# Altium project PCB_Project.PrjPcb
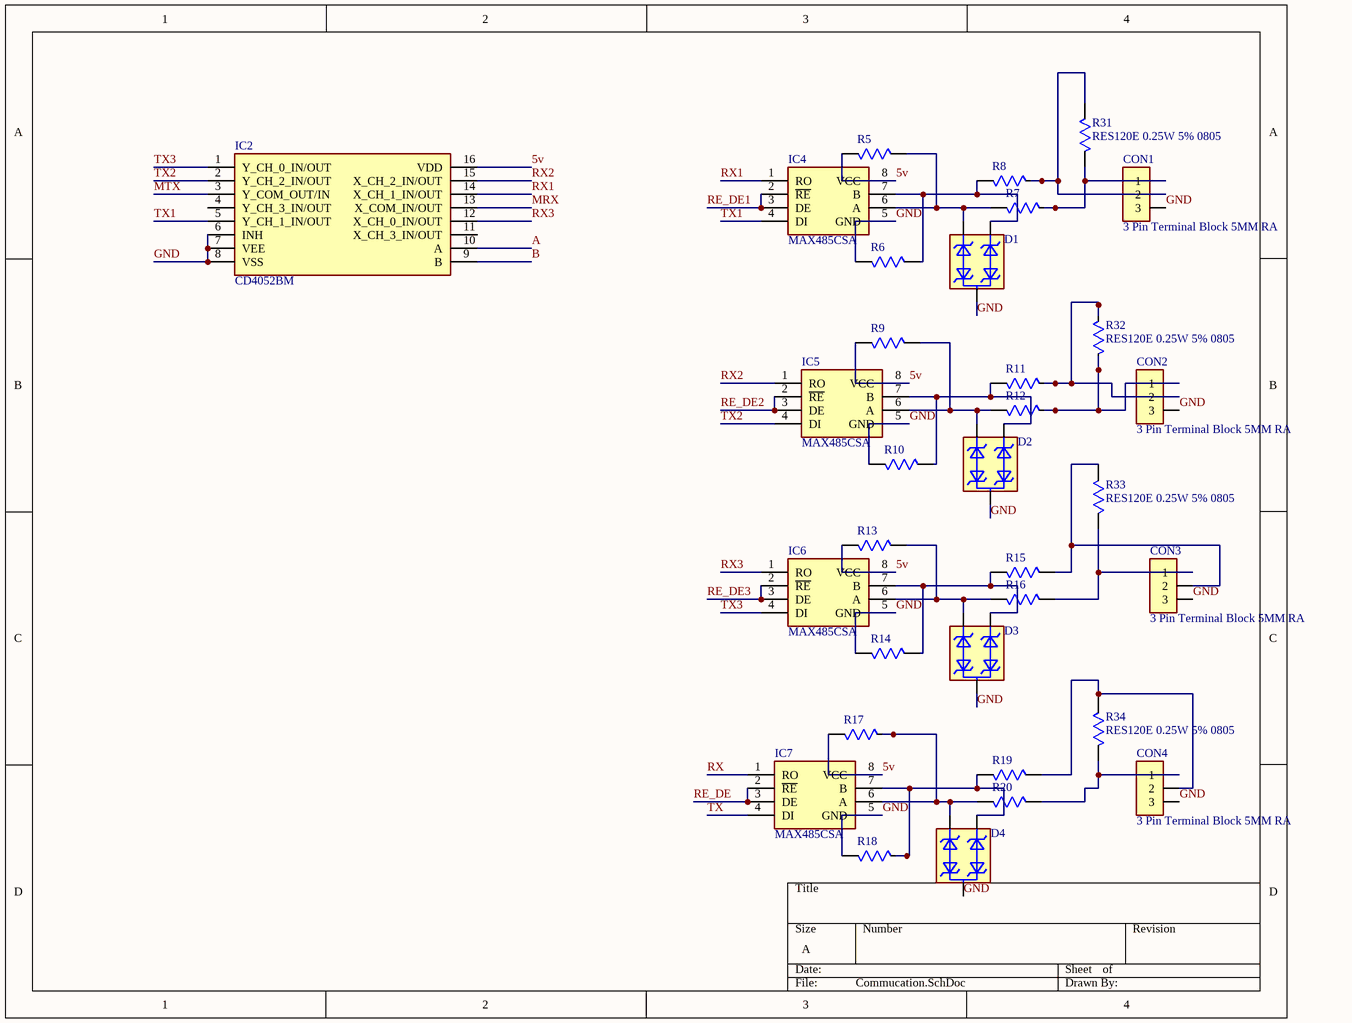
[diagram p0: Commucation.SchDoc]
2 sheets, 57 parts. Net scope: global (net labels, ports and power ports of the same name join across sheets).
Board file: PCB1.PcbDoc
Sheets:
  Commucation.SchDoc
  Power.SchDoc

## Sheet Commucation.SchDoc
size A; SheetNumber: 2; SheetTotal: 3

### Parts
CON1  3 Pin Terminal Block 5MM RA  [3 Pin Terminal Block 5MM RA]
CON2  3 Pin Terminal Block 5MM RA  [3 Pin Terminal Block 5MM RA]
CON3  3 Pin Terminal Block 5MM RA  [3 Pin Terminal Block 5MM RA]
CON4  3 Pin Terminal Block 5MM RA  [3 Pin Terminal Block 5MM RA]
D1  SM712-02HTG  [SOT23]  (value not drawn)
D2  SM712-02HTG  [SOT23]  (value not drawn)
D3  SM712-02HTG  [SOT23]  (value not drawn)
D4  SM712-02HTG  [SOT23]  (value not drawn)
IC2  CD4052BM  [SOIC127P600X175-16N]
IC4  MAX485CSA  [SOIC127P600X175-8N]
IC5  MAX485CSA  [SOIC127P600X175-8N]
IC6  MAX485CSA  [SOIC127P600X175-8N]
IC7  MAX485CSA  [SOIC127P600X175-8N]
R5  RES4.7K 0.25W 5% 0805  [RES 0805 10K/0.25W 5%]  (value not drawn)
R6  RES4.7K 0.25W 5% 0805  [RES 0805 10K/0.25W 5%]  (value not drawn)
R7  RES100E 0.25W 5% 0805  [RES 0805 10K/0.25W 5%]  (value not drawn)
R8  RES100E 0.25W 5% 0805  [RES 0805 10K/0.25W 5%]  (value not drawn)
R9  RES4.7K 0.25W 5% 0805  [RES 0805 10K/0.25W 5%]  (value not drawn)
R10  RES4.7K 0.25W 5% 0805  [RES 0805 10K/0.25W 5%]  (value not drawn)
R11  RES100E 0.25W 5% 0805  [RES 0805 10K/0.25W 5%]  (value not drawn)
R12  RES100E 0.25W 5% 0805  [RES 0805 10K/0.25W 5%]  (value not drawn)
R13  RES4.7K 0.25W 5% 0805  [RES 0805 10K/0.25W 5%]  (value not drawn)
R14  RES4.7K 0.25W 5% 0805  [RES 0805 10K/0.25W 5%]  (value not drawn)
R15  RES100E 0.25W 5% 0805  [RES 0805 10K/0.25W 5%]  (value not drawn)
R16  RES100E 0.25W 5% 0805  [RES 0805 10K/0.25W 5%]  (value not drawn)
R17  RES4.7K 0.25W 5% 0805  [RES 0805 10K/0.25W 5%]  (value not drawn)
R18  RES4.7K 0.25W 5% 0805  [RES 0805 10K/0.25W 5%]  (value not drawn)
R19  RES100E 0.25W 5% 0805  [RES 0805 10K/0.25W 5%]  (value not drawn)
R20  RES100E 0.25W 5% 0805  [RES 0805 10K/0.25W 5%]  (value not drawn)
R31  RES120E 0.25W 5% 0805  [RES 0805 10K/0.25W 5%]
R32  RES120E 0.25W 5% 0805  [RES 0805 10K/0.25W 5%]
R33  RES120E 0.25W 5% 0805  [RES 0805 10K/0.25W 5%]
R34  RES120E 0.25W 5% 0805  [RES 0805 10K/0.25W 5%]

### Nets
5v: IC2.16(VDD) IC4.8(VCC) IC5.8(VCC) IC6.8(VCC) IC7.8(VCC) R5.1 R9.1 R13.1 R17.1
A: IC2.10(A)
B: IC2.9(B)
GND: CON1.3 CON2.3 CON3.3 CON4.3 D1.3 D2.3 D3.3 D4.3 IC2.6(INH) IC2.7(VEE) IC2.8(VSS) IC4.5(GND) IC5.5(GND) IC6.5(GND) IC7.5(GND) R6.1 R10.1 R14.1 R18.1
MRX: IC2.13(X_COM_IN/OUT)
MTX: IC2.3(Y_COM_OUT/IN)
RE_DE: IC7.2(~{RE}) IC7.3(DE)
RE_DE1: IC4.2(~{RE}) IC4.3(DE)
RE_DE2: IC5.2(~{RE}) IC5.3(DE)
RE_DE3: IC6.2(~{RE}) IC6.3(DE)
RX: IC7.1(RO)
RX1: IC2.14(X_CH_1_IN/OUT) IC4.1(RO)
RX2: IC2.15(X_CH_2_IN/OUT) IC5.1(RO)
RX3: IC2.12(X_CH_0_IN/OUT) IC6.1(RO)
TX: IC7.4(DI)
TX1: IC2.5(Y_CH_1_IN/OUT) IC4.4(DI)
TX2: IC2.2(Y_CH_2_IN/OUT) IC5.4(DI)
TX3: IC2.1(Y_CH_0_IN/OUT) IC6.4(DI)
NetCON1_1: CON1.1 R7.2 R31.1
NetCON1_2: CON1.2 R8.2 R31.2
NetCON2_1: CON2.1 R12.2 R32.1
NetCON2_2: CON2.2 R11.2 R32.2
NetCON3_1: CON3.1 R16.2 R33.1
NetCON3_2: CON3.2 R15.2 R33.2
NetCON4_1: CON4.1 R20.2 R34.1
NetCON4_2: CON4.2 R19.2 R34.2
NetD1_1: D1.1 IC4.7(B) R6.2 R8.1
NetD1_2: D1.2 IC4.6(A) R5.2 R7.1
NetD2_1: D2.1 IC5.7(B) R10.2 R11.1
NetD2_2: D2.2 IC5.6(A) R9.2 R12.1
NetD3_1: D3.1 IC6.7(B) R14.2 R15.1
NetD3_2: D3.2 IC6.6(A) R13.2 R16.1
NetD4_1: D4.1 IC7.7(B) R18.2 R19.1
NetD4_2: D4.2 IC7.6(A) R17.2 R20.1

Not connected (* = marked no-connect by the designer): IC2 4(Y_CH_3_IN/OUT) 11(X_CH_3_IN/OUT)

### Library data of the parts
CON1-CON4 = 3 Pin Terminal Block 5MM RA: 3 Pin Terminal Block HDR 5MM THT RA 231-433_001-000; MP: 231-433/001-000; MF: WAGO; SnapEDA_Link: https://www.snapeda.com/parts/231-433/001-000/WAGO/view-part/482062/?ref=snap; Package: None; Availability: Unavailable; Price: None; Value: *
D1-D4 = SM712-02HTG: TVS Diode, SM712 Series, 31V Clamp, 600W Peak Pulse, Surface Mount, SOT23-3 | Littelfuse SM712-02HTG; MF: Littelfuse Inc.; SnapEDA_Link: https://www.snapeda.com/parts/SM712-02HTG/Littelfuse/view-part/?ref=snap; Package: SOT-23 Littelfuse Inc.; Value: *; MP: SM712-02HTG; Check_prices: https://www.snapeda.com/parts/SM712-02HTG/Littelfuse/view-part/?ref=eda
IC2 = CD4052BM: CMOS Differential 4-Channel Analog Multiplexer/Demultiplexer with Logic-Level Conversion; Manufacturer_Name: Texas Instruments; Geometry.Height: 1.75mm; Manufacturer_Part_Number: CD4052BM; Mouser Part Number: 595-CD4052BM; Mouser Price/Stock: https://www.mouser.co.uk/ProductDetail/Texas-Instruments/CD4052BM?qs=LSR%252BNeaw%2FwAMfT6cddU6yA%3D%3D; Arrow Part Number: CD4052BM; Arrow Price/Stock: https://www.arrow.com/en/products/cd4052bm/texas-instruments?region=nac; Datasheet Link: http://www.ti.com/lit/ds/symlink/cd4052b.pdf
IC4-IC7 = MAX485CSA: Maxim MAX485CSA, Line Transceiver, RS-422, RS-485, 4.75  5.25 V, 8-Pin SOIC; Manufacturer_Name: Analog Devices; Geometry.Height: 1.75mm; Manufacturer_Part_Number: MAX485CSA; Mouser Part Number: N/A; Mouser Price/Stock: https://www.mouser.co.uk/ProductDetail/Maxim-Integrated/MAX485CSA?qs=LHmEVA8xxfbb%2FSUlm%252BHF3Q%3D%3D; Arrow Part Number: *; Arrow Price/Stock: *; Datasheet Link: https://datasheets.maximintegrated.com/en/ds/MAX1487-MAX491.pdf
R5 = RES 10K 0.25W 5% 0805: RESISTOR, THICK FILM, 4.7K, 5%, 0805 0.25W SMT; MP: ERJ-6GEYJ103V; MF: Panasonic Electronic; Price: None; Check_prices: https://www.snapeda.com/parts/ERJ-6GEYJ103V/Panasonic+Electronic+Components/view-part/?ref=eda; Package: 805-2 Panasonic; Purchase-URL: https://pricing.snapeda.com/search/part/ERJ-6GEYJ103V/?ref=eda; Availability: In Stock; SnapEDA_Link: https://www.snapeda.com/parts/ERJ-6GEYJ103V/Panasonic+Electronic+Components/view-part/?ref=snap; Value: *
R6-R20 = RES 10K 0.25W 5% 0805: RESISTOR, THICK FILM, 10K, 5%, 0805 0.25W SMT; MP: ERJ-6GEYJ103V; MF: Panasonic Electronic; Price: None; Check_prices: https://www.snapeda.com/parts/ERJ-6GEYJ103V/Panasonic+Electronic+Components/view-part/?ref=eda; Package: 805-2 Panasonic; Purchase-URL: https://pricing.snapeda.com/search/part/ERJ-6GEYJ103V/?ref=eda; Availability: In Stock; SnapEDA_Link: https://www.snapeda.com/parts/ERJ-6GEYJ103V/Panasonic+Electronic+Components/view-part/?ref=snap; Value: *
R31-R34 = RES 10K 0.25W 5% 0805_1: RESISTOR, THICK FILM, 10K, 5%, 0805 0.25W SMT; MP: ERJ-6GEYJ103V; MF: Panasonic Electronic; Price: None; Check_prices: https://www.snapeda.com/parts/ERJ-6GEYJ103V/Panasonic+Electronic+Components/view-part/?ref=eda; Package: 805-2 Panasonic; Purchase-URL: https://pricing.snapeda.com/search/part/ERJ-6GEYJ103V/?ref=eda; Availability: In Stock; SnapEDA_Link: https://www.snapeda.com/parts/ERJ-6GEYJ103V/Panasonic+Electronic+Components/view-part/?ref=snap; Value: *

## Sheet Power.SchDoc
size A; SheetNumber: 3; SheetTotal: 3
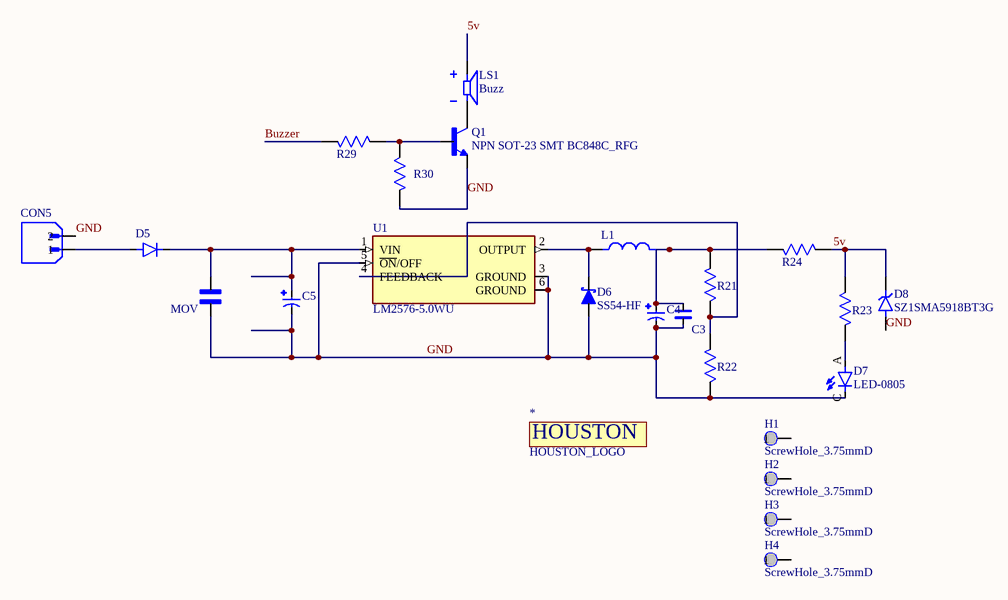
[diagram p1: Power.SchDoc]

### Parts
*  HOUSTON_LOGO  [HOUSTON_LOGO]
C3  CAP 0.1uF 50V 0805  [CAP CER 0.1uF/50V 5%]  (value not drawn)
C4  CAP ELE 10µF 25V TH  [CAP ELE 10µF 25V TH]  (value not drawn)
C5  CAP ELE 10µF 25V TH  [CAP ELE 10µF 25V TH]  (value not drawn)
CON5  2 Pin Terminal Block 5MM RA  [2 Pin Terminal Block 5MM RA]  (value not drawn)
D5  DIODE M7 DO-214AC  [DIODE M7 DO-214AC]  (value not drawn)
D6  SS54-HF  [DIOM5025X220N]
D7  LED-0805  [LED-0805]
D8  SZ1SMA5918BT3G  [DIOM5226X220N]
H1  ScrewHole_3.75mmD  [ScrewHole_3.75mmD - duplicate]
H2  ScrewHole_3.75mmD  [ScrewHole_3.75mmD - duplicate]
H3  ScrewHole_3.75mmD  [ScrewHole_3.75mmD - duplicate]
H4  ScrewHole_3.75mmD  [ScrewHole_3.75mmD - duplicate]
L1  INDUCTOR 8040S SWPA8040S120MT  [INDUCTOR 8040S SWPA8040S120MT]  (value not drawn)
LS1  Buzz  [CUI_CMI-1614-1285T]
MOV  Ceramic capacitor 3300pF4KV  [Ceramic capacitor 3300pF4KV]  (value not drawn)
Q1  NPN SOT-23 SMT BC848C_RFG  [NPN SOT-23 SMT BC848C_RFG]
R21  RES 3K 0.25W 5% 0805  [RES 0805 10K/0.25W 5%]  (value not drawn)
R22  RES 1K 0.25W 5% 0805  [RES 0805 10K/0.25W 5%]  (value not drawn)
R23  RES 330 E 0.25W 5% 0805  [RES 0805 10K/0.25W 5%]  (value not drawn)
R24  RES 3K 0.25W 5% 0805  [RES 0805 10K/0.25W 5%]  (value not drawn)
R29  RES 1K 0.25W 5% 0805  [RES 0805 10K/0.25W 5%]  (value not drawn)
R30  RES 10K 0.25W 5% 0805  [RES 0805 10K/0.25W 5%]  (value not drawn)
U1  LM2576-5.0WU  [DPAK6P170_1524X459L254X81N]

### Nets
5v: D8.C LS1.P R23.1 R24.1
Buzzer: R29.2
GND: C3.1 C4.N C5.N CON5.2 D6.2(A) D7.C D8.A MOV.1 Q1.2(E) R22.1 R30.2 U1.3(GROUND) U1.5(~{ON}/OFF) U1.6(GROUND)
NetC3_2: C3.2 C4.P L1.2 R21.2 R24.2
NetC5_P: C5.P D5.C(K) MOV.2 U1.1(VIN)
NetCON5_1: CON5.1 D5.A
NetD6_1: D6.1(K) L1.1 U1.2(OUTPUT)
NetD7_A: D7.A R23.2
NetLS1_N: LS1.N Q1.3(C)
NetQ1_1: Q1.1(B) R29.1 R30.1
NetR21_1: R21.1 R22.2 U1.4(FEEDBACK)

Not connected (* = marked no-connect by the designer): H1 1; H2 1; H3 1; H4 1

### Notes on the sheet
- (in symbol TANT CAP 10uF/16V 5% 3528(B)) +

### Library data of the parts
C3 = CAP CER 0.1uF/50V 5%: CAP CER 0.1uF/50V  Ceramic Capacitor X7R 0805 (2012 Metric) SMT; MF: Samsung; MP: CL21B104KCFNNNE; Purchase-URL: https://pricing.snapeda.com/search?q=CL21B104KCFNNNE&ref=eda; Package: 0805 Samsung; Check_prices: https://www.snapeda.com/parts/CL21B104KCFNNNE/Samsung+Electro-Mechanics/view-part/?ref=eda; Value: *; SnapEDA_Link: https://www.snapeda.com/parts/CL21B104KCFNNNE/Samsung+Electro-Mechanics/view-part/?ref=snap; Digi-Key_Part_Number: 1276-6840-2-ND
C4 C5 = CAP ELE 10µF 25V TH_1: 10µF 25V Aluminum Electrolytic Capacitors Radial Lead Type THT, Dia-5mm, Pitch-2mm ECEA1EN100UI; MF: Panasonic; Package: RADIAL-2 Panasonic; Purchase-URL: https://pricing.snapeda.com/search/part/ECEA1EN100UI/?ref=eda; Value: *; Digi-Key_Part_Number: ECE-A1EN100UI-ND; SnapEDA_Link: https://www.snapeda.com/parts/ECEA1EN100UI/Panasonic/view-part/5788532/?ref=snap; MP: ECEA1EN100UI; Check_prices: https://www.snapeda.com/parts/ECEA1EN100UI/Panasonic/view-part/5788532/?ref=eda
CON5 = 2 Pin Terminal Block 5MM RA: 2 Pin Terminal Block HDR 5MM THT RA _OQ0271510000G; MF: Amphenol Anytek; SnapEDA_Link: https://www.snapeda.com/parts/OQ0271510000G/Amphenol/view-part/?ref=snap; Package: None; Value: *; MP: OQ0271510000G; Check_prices: https://www.snapeda.com/parts/OQ0271510000G/Amphenol/view-part/?ref=eda
D5 = DIODE M7 DO-214AC: M7 General Purpose SMD Rectifier Diode SMA (DO-214AC) 1A 1000V 1n4007 RS2MA; MF: Taiwan Semiconductor; SnapEDA_Link: https://www.snapeda.com/parts/RS2MA/Taiwan+Semiconductor/view-part/?ref=snap; Package: DO-214AC-2 Taiwan Semiconductor; Value: *; MP: RS2MA; Check_prices: https://www.snapeda.com/parts/RS2MA/Taiwan+Semiconductor/view-part/?ref=eda
D6 = SS54-HF: Diode Schottky 40 V 5A Surface Mount DO-214AC (SMA); MF: Comchip Technology; SnapEDA_Link: https://www.snapeda.com/parts/SS54-HF/Comchip/view-part/?ref=snap; Package: DO-214AC-214 Comchip Technology; Value: *; MP: SS54-HF; Check_prices: https://www.snapeda.com/parts/SS54-HF/Comchip/view-part/?ref=eda
D7 = LED-0805: Red 640nm LED Indication - Discrete 1.85V 0805 (2012 Metric) SMT APT2012SRCPRV; MF: Kingbright; SnapEDA_Link: https://www.snapeda.com/parts/APT2012SRCPRV/Kingbright/view-part/?ref=snap; Package: 0805 Kingbright; Value: *; MP: APT2012SRCPRV; Check_prices: https://www.snapeda.com/parts/APT2012SRCPRV/Kingbright/view-part/?ref=eda
D8 = SZ1SMA5918BT3G: Zener Diode 5.1 V 1.5 W Â±5% Surface Mount SMA; MF: ON Semiconductor; SnapEDA_Link: https://www.snapeda.com/parts/SZ1SMA5918BT3G/Onsemi/view-part/?ref=snap; Package: SMA-2 ON Semiconductor; Value: *; MP: SZ1SMA5918BT3G; Check_prices: https://www.snapeda.com/parts/SZ1SMA5918BT3G/Onsemi/view-part/?ref=eda
H1-H4 = ScrewHole_3.75mmD: SCREW HEAD DIA 4.5MM, SREW LEG DIA 3 MM
L1 = INDUCTOR 8040S SWPA8040S120MT: SWPA8040S120MT SMD 8.0×8.0x4.0mm 8040S 12uH Â±20% 2.8A 142 mOhm SMT Shielded Wirewound Inductor; MF: Abracon LLC; MP: ASPI-8040S-510M-T; Purchase-URL: https://pricing.snapeda.com/search/part/ASPI-8040S-510M-T/?ref=eda; Value: *; SnapEDA_Link: https://www.snapeda.com/parts/ASPI-8040S-510M-T/Abracon+LLC/view-part/?ref=snap; Package: Nonstandard Abracon LLC; Check_prices: https://www.snapeda.com/parts/ASPI-8040S-510M-T/Abracon+LLC/view-part/?ref=eda; Availability: In Stock; Price: None
LS1 = CMI-1614-1285T: 16 mm, 12 Vdc, 85 dB, Through Hole, Driving Circuit, Magnetic Audio Indicator Buzzer; MF: Same Sky; SnapEDA_Link: https://www.snapeda.com/parts/CMI-1614-1285T/Same+Sky/view-part/?ref=snap; Package: CUI Inc.; Value: *; MP: CMI-1614-1285T; Check_prices: https://www.snapeda.com/parts/CMI-1614-1285T/Same+Sky/view-part/?ref=eda
MOV = Ceramic capacitor 3300pF4KV: Ceramic capacitor 3300pF4KV, Tension nominale 400Vac(r.m.s.), 4KV ESD, DE2E3SA332MA3BY02F; MF: Murata; Package: NONSTANDARD; Value: *; Purchase-URL: https://pricing.snapeda.com/search/part/DE2E3SA332MA3BY02F/?ref=eda; Availability: Bad; SnapEDA_Link: https://www.snapeda.com/parts/DE2E3SA332MA3BY02F/Murata/view-part/2799752/?ref=snap; Price: None; MP: DE2E3SA332MA3BY02F; Check_prices: https://www.snapeda.com/parts/DE2E3SA332MA3BY02F/Murata/view-part/2799752/?ref=eda
Q1 = NPN SOT-23 SMT BC848C_RFG: NPN SMT BC848C_RFG SOT-23, 30V, 0.1A, NPN Transistor; MF: Taiwan Semiconductor; MP: BC848C RFG; SnapEDA_Link: https://www.snapeda.com/parts/BC848C%20RFG/Taiwan+Semiconductor/view-part/?ref=snap; Package: SOT-23 Taiwan Semiconductor; Value: *; Check_prices: https://www.snapeda.com/parts/BC848C%20RFG/Taiwan+Semiconductor/view-part/?ref=eda
R21-R24 R29 R30 = RES 10K 0.25W 5% 0805: as R6 on sheet Commucation; Price: None; Check_prices: https://www.snapeda.com/parts/ERJ-6GEYJ103V/Panasonic+Electronic+Components/view-part/?ref=eda; Package: 805-2 Panasonic; Purchase-URL: https://pricing.snapeda.com/search/part/ERJ-6GEYJ103V/?ref=eda; Availability: In Stock; SnapEDA_Link: https://www.snapeda.com/parts/ERJ-6GEYJ103V/Panasonic+Electronic+Components/view-part/?ref=snap; Value: *
U1 = LM2576-5.0WU: Buck Switching Regulator IC Positive Fixed 5V 1 Output 3A TO-263-6, D2PAK (5 Leads + Tab), TO-263BA; MF: Microchip; SnapEDA_Link: https://www.snapeda.com/parts/LM2576-5.0WU/Microchip/view-part/?ref=snap; Package: TO-263-5 Micrel; Value: *; MP: LM2576-5.0WU; Check_prices: https://www.snapeda.com/parts/LM2576-5.0WU/Microchip/view-part/?ref=eda

## Nets that join several sheets
5v: Commucation (9 pins), Power (D8.C LS1.P R23.1 R24.1)
GND: Commucation (19 pins), Power (14 pins)